# Altium project 6axisMIK.PrjPcb
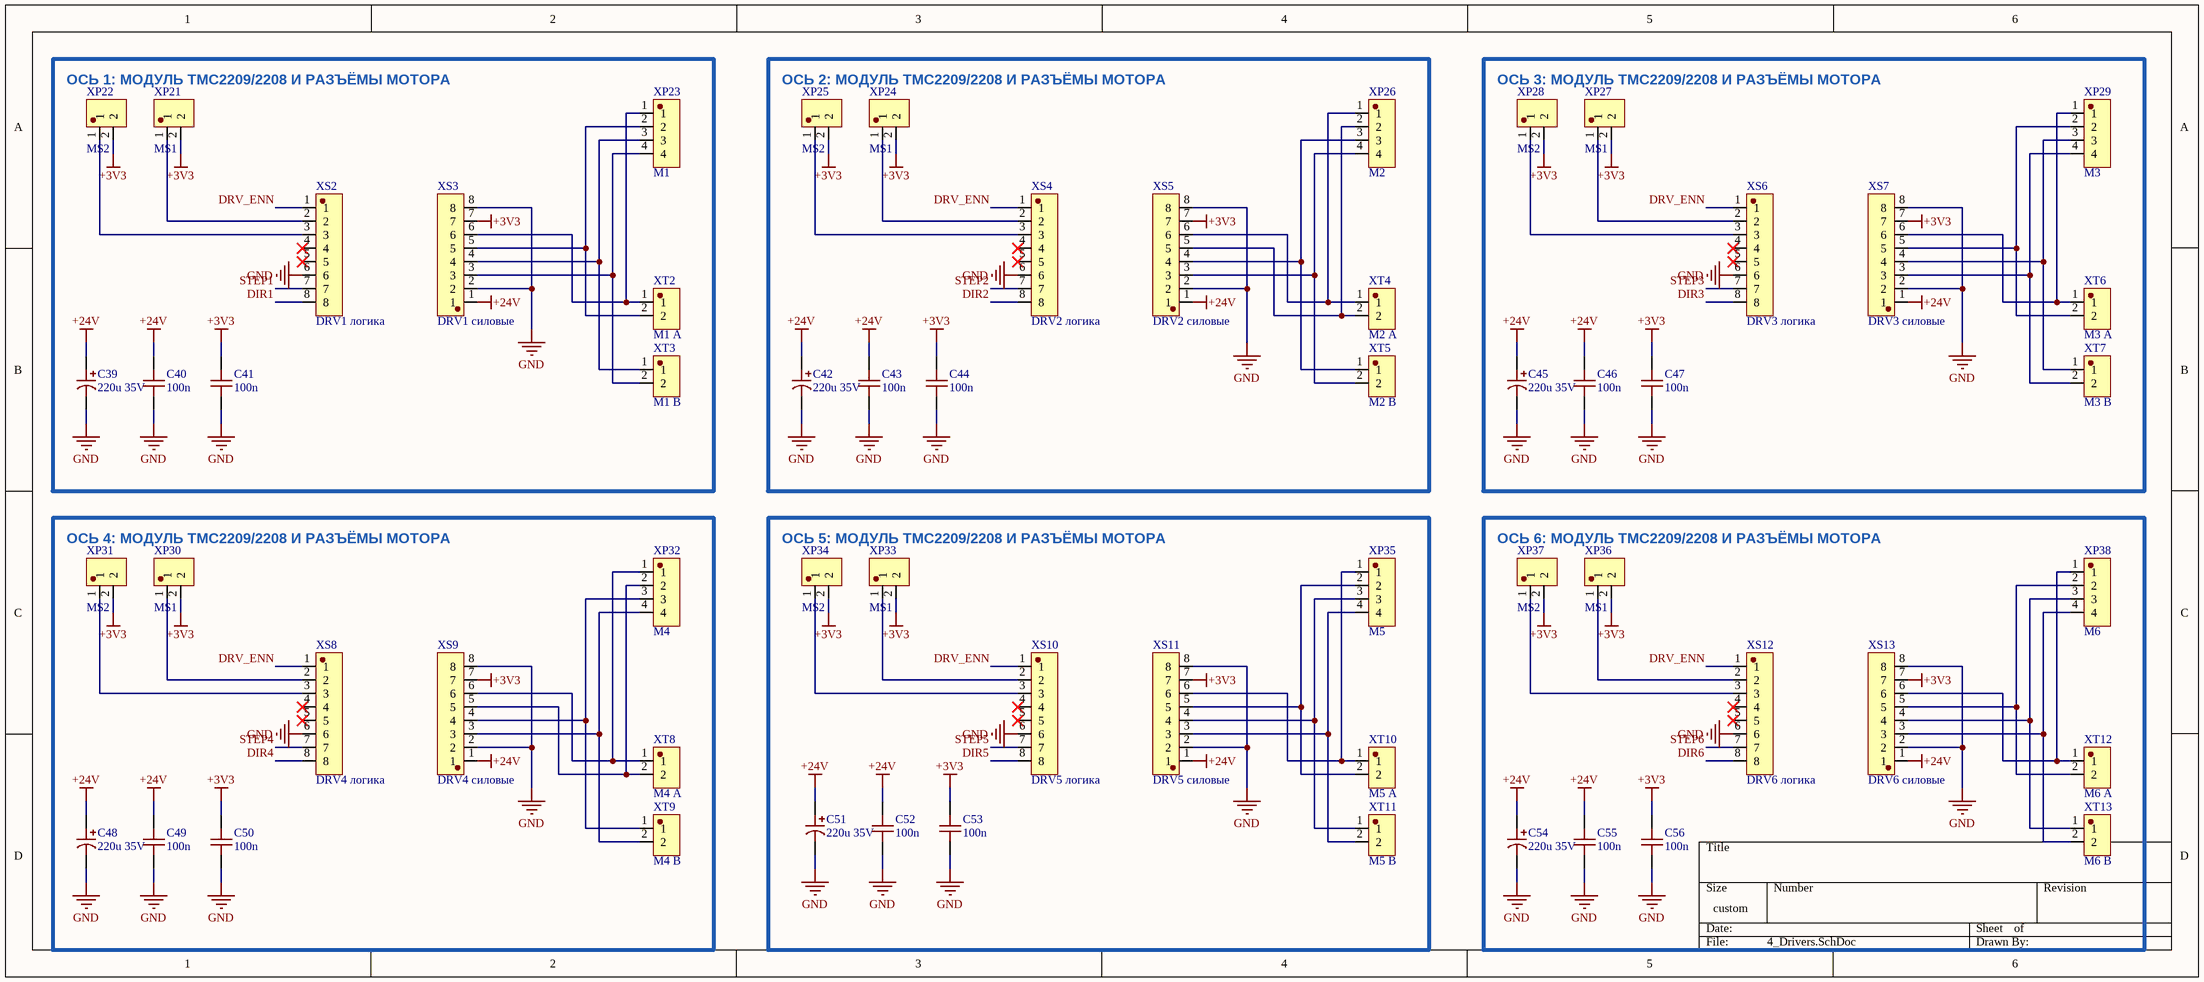
[diagram p0: 4_Drivers.SchDoc]
4 sheets, 200 parts. Net scope: global (net labels, ports and power ports of the same name join across sheets).
Board file: PCB1.PcbDoc
Sheets:
  4_Drivers.SchDoc
  3_IO.SchDoc
  1_Power.SchDoc
  2_MCU.SchDoc

## Sheet 4_Drivers.SchDoc
size 412 x 182 mm; SheetNumber: 1; SheetTotal: 4

### Parts
C39  220u 35V  [CAP-TH_BD8.0-P3.50-D0.5-FD]
C40  100n  [C0603]
C41  100n  [C0603]
C42  220u 35V  [CAP-TH_BD8.0-P3.50-D0.5-FD]
C43  100n  [C0603]
C44  100n  [C0603]
C45  220u 35V  [CAP-TH_BD8.0-P3.50-D0.5-FD]
C46  100n  [C0603]
C47  100n  [C0603]
C48  220u 35V  [CAP-TH_BD8.0-P3.50-D0.5-FD]
C49  100n  [C0603]
C50  100n  [C0603]
C51  220u 35V  [CAP-TH_BD8.0-P3.50-D0.5-FD]
C52  100n  [C0603]
C53  100n  [C0603]
C54  220u 35V  [CAP-TH_BD8.0-P3.50-D0.5-FD]
C55  100n  [C0603]
C56  100n  [C0603]
XP21  MS1  [HDR-TH_2P-P2.54-V-M]
XP22  MS2  [HDR-TH_2P-P2.54-V-M]
XP23  M1  [HDR-TH_4P-P2.54-V-M]
XP24  MS1  [HDR-TH_2P-P2.54-V-M]
XP25  MS2  [HDR-TH_2P-P2.54-V-M]
XP26  M2  [HDR-TH_4P-P2.54-V-M]
XP27  MS1  [HDR-TH_2P-P2.54-V-M]
XP28  MS2  [HDR-TH_2P-P2.54-V-M]
XP29  M3  [HDR-TH_4P-P2.54-V-M]
XP30  MS1  [HDR-TH_2P-P2.54-V-M]
XP31  MS2  [HDR-TH_2P-P2.54-V-M]
XP32  M4  [HDR-TH_4P-P2.54-V-M]
XP33  MS1  [HDR-TH_2P-P2.54-V-M]
XP34  MS2  [HDR-TH_2P-P2.54-V-M]
XP35  M5  [HDR-TH_4P-P2.54-V-M]
XP36  MS1  [HDR-TH_2P-P2.54-V-M]
XP37  MS2  [HDR-TH_2P-P2.54-V-M]
XP38  M6  [HDR-TH_4P-P2.54-V-M]
XS2  DRV1 логика  [HDR-TH_PZ254V-11-08P-A40]
XS3  DRV1 силовые  [HDR-TH_PZ254V-11-08P-A40]
XS4  DRV2 логика  [HDR-TH_PZ254V-11-08P-A40]
XS5  DRV2 силовые  [HDR-TH_PZ254V-11-08P-A40]
XS6  DRV3 логика  [HDR-TH_PZ254V-11-08P-A40]
XS7  DRV3 силовые  [HDR-TH_PZ254V-11-08P-A40]
XS8  DRV4 логика  [HDR-TH_PZ254V-11-08P-A40]
XS9  DRV4 силовые  [HDR-TH_PZ254V-11-08P-A40]
XS10  DRV5 логика  [HDR-TH_PZ254V-11-08P-A40]
XS11  DRV5 силовые  [HDR-TH_PZ254V-11-08P-A40]
XS12  DRV6 логика  [HDR-TH_PZ254V-11-08P-A40]
XS13  DRV6 силовые  [HDR-TH_PZ254V-11-08P-A40]
XT2  M1 A  [CONN-TH_P3.50_KF350-3.5-2P]
XT3  M1 B  [CONN-TH_P3.50_KF350-3.5-2P]
XT4  M2 A  [CONN-TH_P3.50_KF350-3.5-2P]
XT5  M2 B  [CONN-TH_P3.50_KF350-3.5-2P]
XT6  M3 A  [CONN-TH_P3.50_KF350-3.5-2P]
XT7  M3 B  [CONN-TH_P3.50_KF350-3.5-2P]
XT8  M4 A  [CONN-TH_P3.50_KF350-3.5-2P]
XT9  M4 B  [CONN-TH_P3.50_KF350-3.5-2P]
XT10  M5 A  [CONN-TH_P3.50_KF350-3.5-2P]
XT11  M5 B  [CONN-TH_P3.50_KF350-3.5-2P]
XT12  M6 A  [CONN-TH_P3.50_KF350-3.5-2P]
XT13  M6 B  [CONN-TH_P3.50_KF350-3.5-2P]

### Blocks framed on the sheet
ОСЬ 1: МОДУЛЬ TMC2209/2208 И РАЗЪЁМЫ МОТОРА: C39-C41 XP21-XP23 XS2 XS3 XT2 XT3
ОСЬ 2: МОДУЛЬ TMC2209/2208 И РАЗЪЁМЫ МОТОРА: C42-C44 XP24-XP26 XS4 XS5 XT4 XT5
ОСЬ 3: МОДУЛЬ TMC2209/2208 И РАЗЪЁМЫ МОТОРА: C45-C47 XP27-XP29 XS6 XS7 XT6 XT7
ОСЬ 4: МОДУЛЬ TMC2209/2208 И РАЗЪЁМЫ МОТОРА: C48-C50 XP30-XP32 XS8 XS9 XT8 XT9
ОСЬ 5: МОДУЛЬ TMC2209/2208 И РАЗЪЁМЫ МОТОРА: C51-C53 XP33-XP35 XS10 XS11 XT10 XT11
ОСЬ 6: МОДУЛЬ TMC2209/2208 И РАЗЪЁМЫ МОТОРА: C54-C56 XP36-XP38 XS12 XS13 XT12 XT13

### Nets
+3V3: C41.1 C44.1 C47.1 C50.1 C53.1 C56.1 XP21.2 XP22.2 XP24.2 XP25.2 XP27.2 XP28.2 XP30.2 XP31.2 XP33.2 XP34.2 XP36.2 XP37.2 XS3.7 XS5.7 XS7.7 XS9.7 XS11.7 XS13.7
+24V: C39.1 C40.1 C42.1 C43.1 C45.1 C46.1 C48.1 C49.1 C51.1 C52.1 C54.1 C55.1 XS3.1 XS5.1 XS7.1 XS9.1 XS11.1 XS13.1
GND: C39.2 C40.2 C41.2 C42.2 C43.2 C44.2 C45.2 C46.2 C47.2 C48.2 C49.2 C50.2 C51.2 C52.2 C53.2 C54.2 C55.2 C56.2 XS2.6 XS3.2 XS3.8 XS4.6 XS5.2 XS5.8 XS6.6 XS7.2 XS7.8 XS8.6 XS9.2 XS9.8 XS10.6 XS11.2 XS11.8 XS12.6 XS13.2 XS13.8
DIR1: XS2.8
DIR2: XS4.8
DIR3: XS6.8
DIR4: XS8.8
DIR5: XS10.8
DIR6: XS12.8
DRV_ENN: XS2.1 XS4.1 XS6.1 XS8.1 XS10.1 XS12.1
STEP1: XS2.7
STEP2: XS4.7
STEP3: XS6.7
STEP4: XS8.7
STEP5: XS10.7
STEP6: XS12.7
NetXP21_1: XP21.1 XS2.2
NetXP22_1: XP22.1 XS2.3
NetXP23_1: XP23.1 XS3.6 XT2.1
NetXP23_2: XP23.2 XS3.5 XT2.2
NetXP23_3: XP23.3 XS3.4 XT3.1
NetXP23_4: XP23.4 XS3.3 XT3.2
NetXP24_1: XP24.1 XS4.2
NetXP25_1: XP25.1 XS4.3
NetXP26_1: XP26.1 XS5.6 XT4.1
NetXP26_2: XP26.2 XS5.5 XT4.2
NetXP26_3: XP26.3 XS5.4 XT5.1
NetXP26_4: XP26.4 XS5.3 XT5.2
NetXP27_1: XP27.1 XS6.2
NetXP28_1: XP28.1 XS6.3
NetXP29_1: XP29.1 XS7.6 XT6.1
NetXP29_2: XP29.2 XS7.5 XT6.2
NetXP29_3: XP29.3 XS7.4 XT7.1
NetXP29_4: XP29.4 XS7.3 XT7.2
NetXP30_1: XP30.1 XS8.2
NetXP31_1: XP31.1 XS8.3
NetXP32_1: XP32.1 XS9.6 XT8.1
NetXP32_2: XP32.2 XS9.5 XT8.2
NetXP32_3: XP32.3 XS9.4 XT9.1
NetXP32_4: XP32.4 XS9.3 XT9.2
NetXP33_1: XP33.1 XS10.2
NetXP34_1: XP34.1 XS10.3
NetXP35_1: XP35.1 XS11.6 XT10.1
NetXP35_2: XP35.2 XS11.5 XT10.2
NetXP35_3: XP35.3 XS11.4 XT11.1
NetXP35_4: XP35.4 XS11.3 XT11.2
NetXP36_1: XP36.1 XS12.2
NetXP37_1: XP37.1 XS12.3
NetXP38_1: XP38.1 XS13.6 XT12.1
NetXP38_2: XP38.2 XS13.5 XT12.2
NetXP38_3: XP38.3 XS13.4 XT13.1
NetXP38_4: XP38.4 XS13.3 XT13.2

Not connected (* = marked no-connect by the designer): XS2 4* 5*; XS4 4* 5*; XS6 4* 5*; XS8 4* 5*; XS10 4* 5*; XS12 4* 5*

### Library data of the parts
C39 C42 C45 C48 C51 C54 = 220UF35V8X12KM: Manufacturer: Econd; Value: 220uF; Manufacturer Part Number: 220uF35V8x12KM; LCSC Part: C49304872; Supplier: LCSC; Supplier Part Number: C49304872; JLCPCB Part Class: Extended Part; Datasheet: https://www.lcsc.com/datasheet/C49304872.pdf; Source: JLCEDA/EasyEDA Official Library (https://easyeda.com, https://lceda.cn)
C40 C41 C43 C44 C46 C47 C49 C50 C52 C53 C55 C56 = CL10B104KB8NNNC/0603: Manufacturer Part Number: CL10B104KB8NNNC/0603; LCSC Part: C9900007620; Supplier: LCSC; Supplier Part Number: C9900007620; Datasheet: https://www.lcsc.com/datasheet/C9900007620.pdf; Source: JLCEDA/EasyEDA Official Library (https://easyeda.com, https://lceda.cn)
XP21 XP22 XP24 XP25 XP27 XP28 XP30 XP31 XP33 XP34 XP36 XP37 = PZ254V-11-02P: Manufacturer: XFCN; Manufacturer Part Number: PZ254V-11-02P; LCSC Part: C492401; Supplier: LCSC; Supplier Part Number: C492401; JLCPCB Part Class: Extended Part; Datasheet: https://www.lcsc.com/datasheet/C492401.pdf; LCSC URL: https://lcsc.com/product-detail/New-Arrivals_XFCN-PZ254V-11-02P_C492401.html; Source: JLCEDA/EasyEDA Official Library (https://easyeda.com, https://lceda.cn)
XP23 XP26 XP29 XP32 XP35 XP38 = PZ254V-11-04P_C2691448: Manufacturer: XFCN; Manufacturer Part Number: PZ254V-11-04P; LCSC Part: C2691448; Supplier: LCSC; Supplier Part Number: C2691448; JLCPCB Part Class: Extended Part; Datasheet: https://www.lcsc.com/datasheet/C2691448.pdf; Source: JLCEDA/EasyEDA Official Library (https://easyeda.com, https://lceda.cn)
XS2-XS13 = PZ254V-11-08P-A40: Manufacturer: XFCN; Manufacturer Part Number: PZ254V-11-08P-A40; LCSC Part: C42419915; Supplier: LCSC; Supplier Part Number: C42419915; JLCPCB Part Class: Extended Part; Datasheet: https://www.lcsc.com/datasheet/C42419915.pdf; Source: JLCEDA/EasyEDA Official Library (https://easyeda.com, https://lceda.cn)
XT2-XT13 = KF350-3.5-2P: Manufacturer: KEFA; Manufacturer Part Number: KF350-3.5-2P; LCSC Part: C474892; Supplier: LCSC; Supplier Part Number: C474892; JLCPCB Part Class: Extended Part; Datasheet: https://www.lcsc.com/datasheet/C474892.pdf; LCSC URL: https://lcsc.com/product-detail/New-Quadratic-Unclassified-Data_Cixi-Kefa-Elec-KF350-3-5-2P_C474892.html; Source: JLCEDA/EasyEDA Official Library (https://easyeda.com, https://lceda.cn)

## Sheet 3_IO.SchDoc
size 383 x 325 mm; SheetNumber: 2; SheetTotal: 4
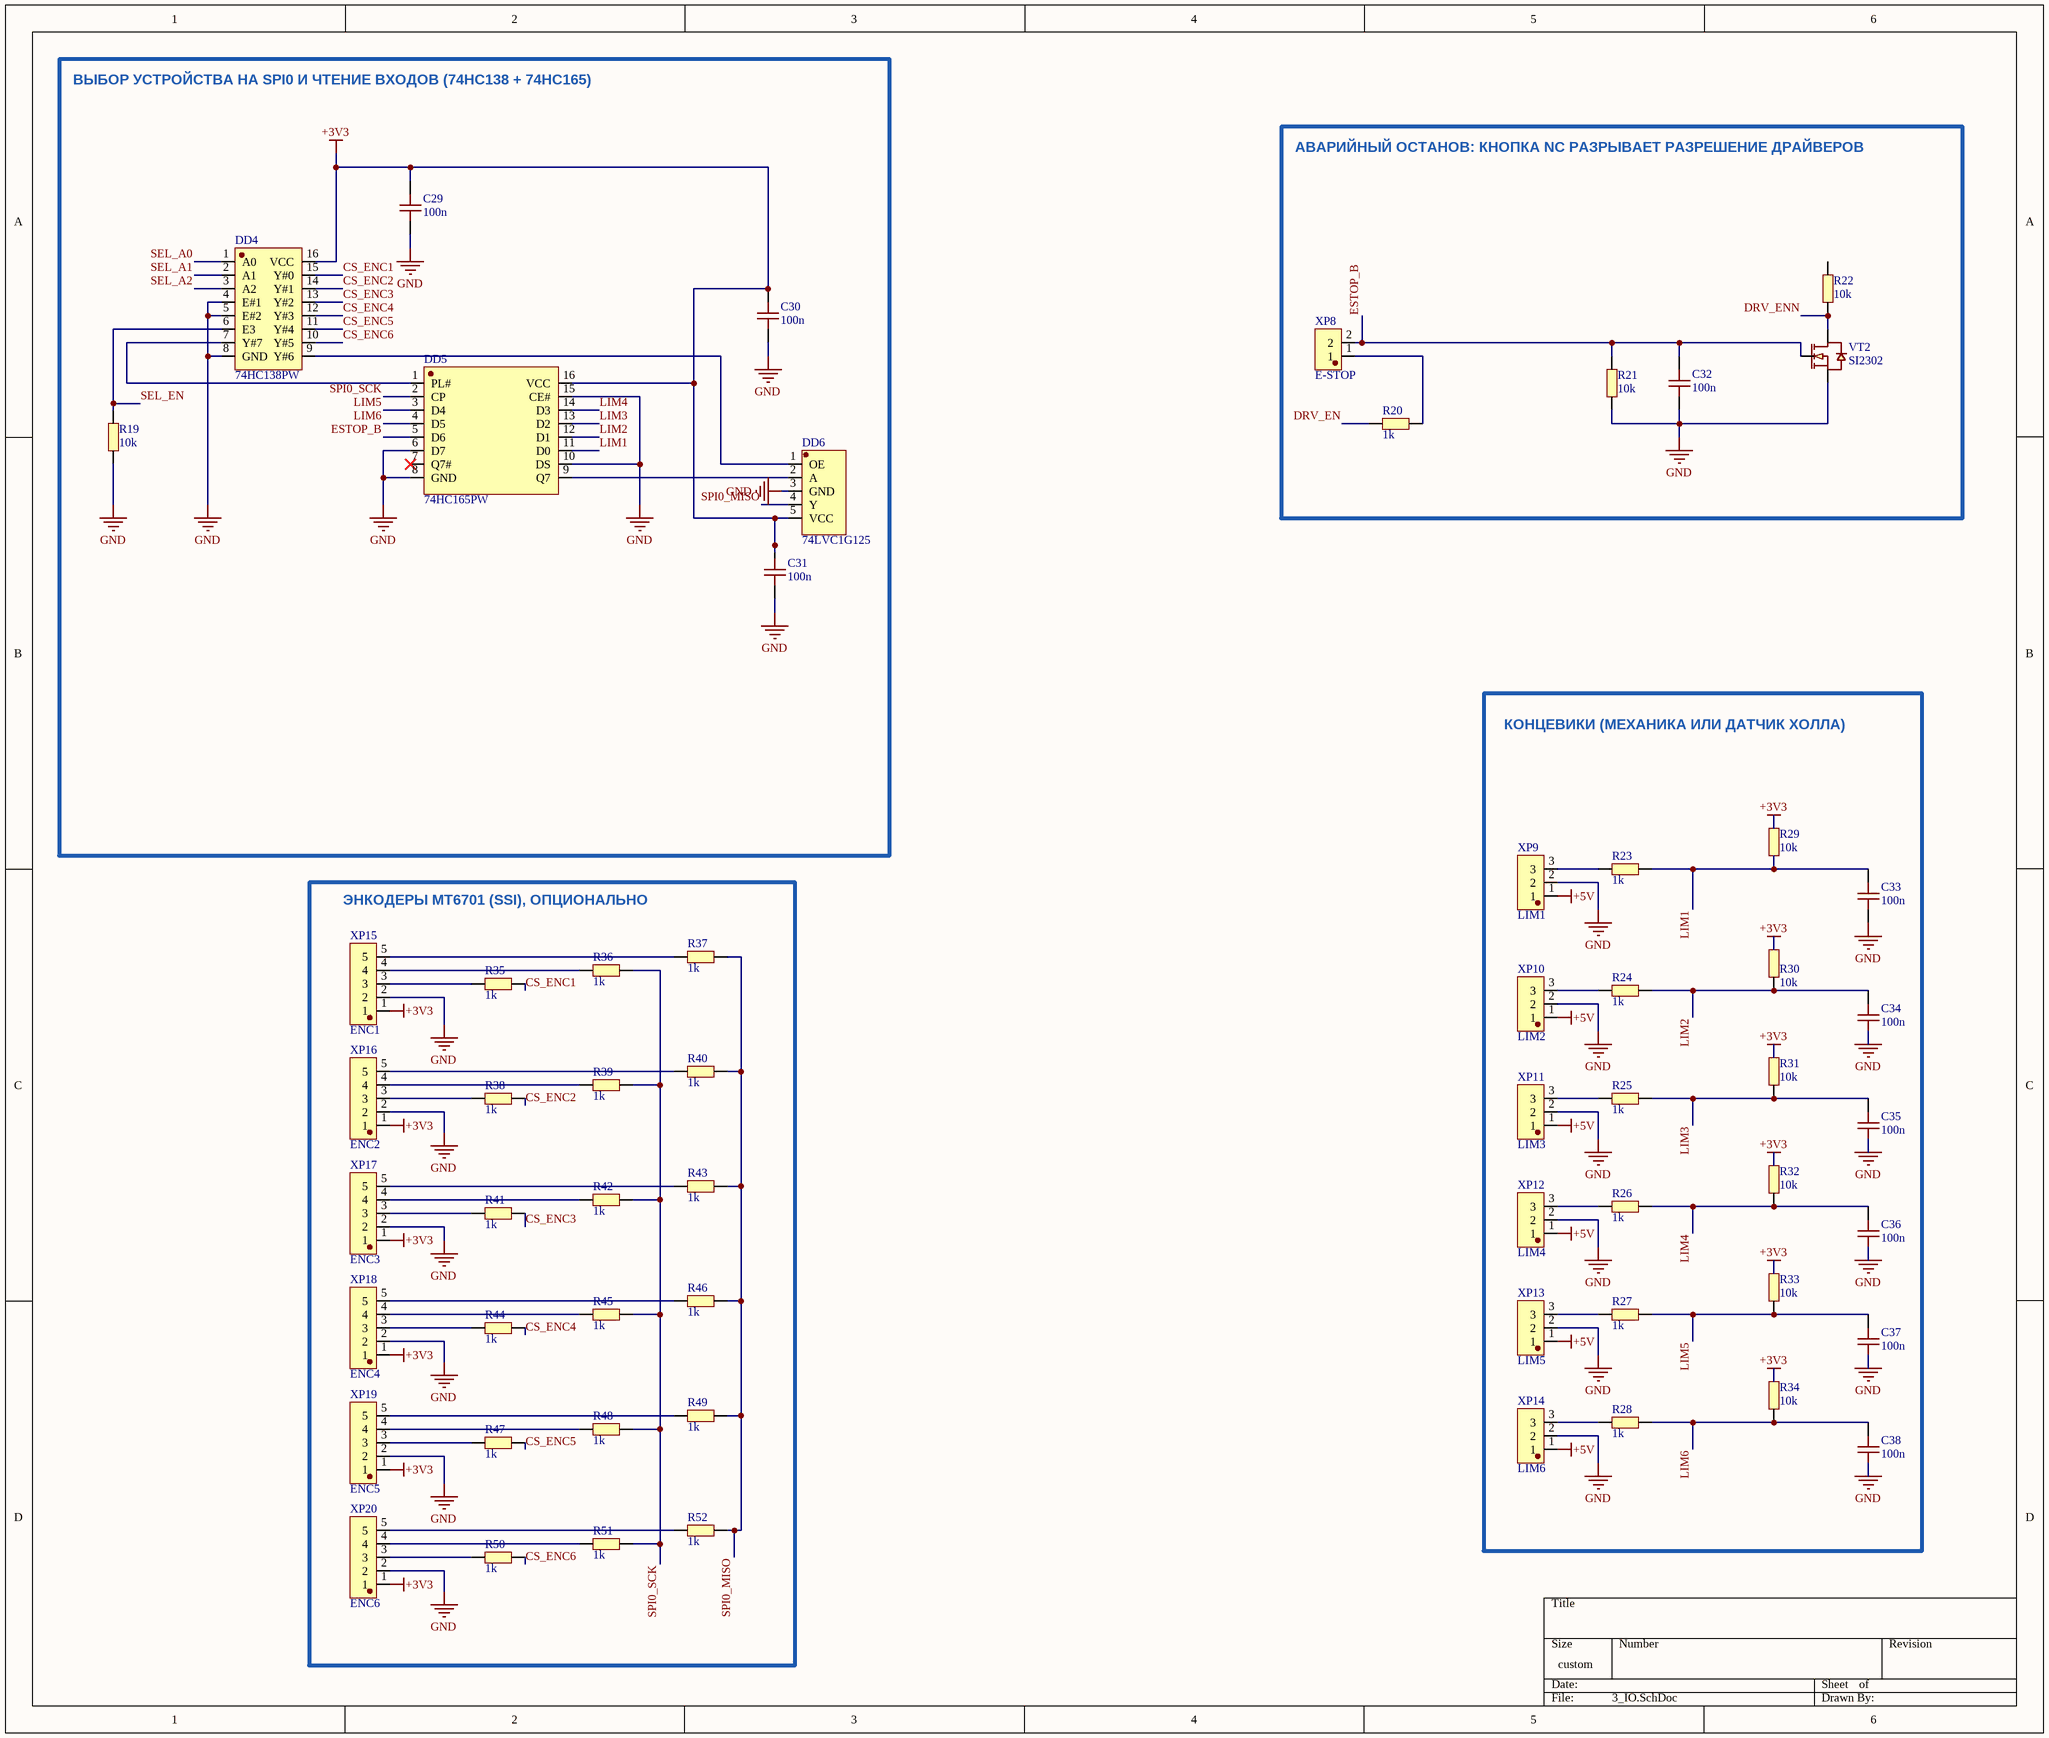
[diagram p1: 3_IO.SchDoc]

### Parts
C29  100n  [C0603]
C30  100n  [C0603]
C31  100n  [C0603]
C32  100n  [C0603]
C33  100n  [C0603]
C34  100n  [C0603]
C35  100n  [C0603]
C36  100n  [C0603]
C37  100n  [C0603]
C38  100n  [C0603]
DD4  74HC138PW  [TSSOP-16_L5.0-W4.4-P0.65-LS6.4-BL]
DD5  74HC165PW  [TSSOP-16_L5.0-W4.4-P0.65-LS6.4-BL]
DD6  74LVC1G125  [SOT-23-5_L3.0-W1.7-P0.95-LS2.8-BL]
R19  10k  [R0603]
R20  1k  [R0603]
R21  10k  [R0603]
R22  10k  [R0603]
R23  1k  [R0603]
R24  1k  [R0603]
R25  1k  [R0603]
R26  1k  [R0603]
R27  1k  [R0603]
R28  1k  [R0603]
R29  10k  [R0603]
R30  10k  [R0603]
R31  10k  [R0603]
R32  10k  [R0603]
R33  10k  [R0603]
R34  10k  [R0603]
R35  1k  [R0603]
R36  1k  [R0603]
R37  1k  [R0603]
R38  1k  [R0603]
R39  1k  [R0603]
R40  1k  [R0603]
R41  1k  [R0603]
R42  1k  [R0603]
R43  1k  [R0603]
R44  1k  [R0603]
R45  1k  [R0603]
R46  1k  [R0603]
R47  1k  [R0603]
R48  1k  [R0603]
R49  1k  [R0603]
R50  1k  [R0603]
R51  1k  [R0603]
R52  1k  [R0603]
VT2  SI2302  [SOT-23-3_L2.9-W1.3-P1.90-LS2.4-BR-CW]
XP8  E-STOP  [HDR-TH_2P-P2.54-V-M]
XP9  LIM1  [HDR-TH_3P-P2.54-V-M_PZ254V-11-03P]
XP10  LIM2  [HDR-TH_3P-P2.54-V-M_PZ254V-11-03P]
XP11  LIM3  [HDR-TH_3P-P2.54-V-M_PZ254V-11-03P]
XP12  LIM4  [HDR-TH_3P-P2.54-V-M_PZ254V-11-03P]
XP13  LIM5  [HDR-TH_3P-P2.54-V-M_PZ254V-11-03P]
XP14  LIM6  [HDR-TH_3P-P2.54-V-M_PZ254V-11-03P]
XP15  ENC1  [HDR-TH_5P-P2.54-V-M]
XP16  ENC2  [HDR-TH_5P-P2.54-V-M]
XP17  ENC3  [HDR-TH_5P-P2.54-V-M]
XP18  ENC4  [HDR-TH_5P-P2.54-V-M]
XP19  ENC5  [HDR-TH_5P-P2.54-V-M]
XP20  ENC6  [HDR-TH_5P-P2.54-V-M]

### Blocks framed on the sheet
ВЫБОР УСТРОЙСТВА НА SPI0 И ЧТЕНИЕ ВХОДОВ (74HC138 + 74HC165): C29-C31 DD4-DD6 R19
АВАРИЙНЫЙ ОСТАНОВ: КНОПКА NC РАЗРЫВАЕТ РАЗРЕШЕНИЕ ДРАЙВЕРОВ: C32 R20-R22 VT2 XP8
КОНЦЕВИКИ (МЕХАНИКА ИЛИ ДАТЧИК ХОЛЛА): C33-C38 R23-R34 XP9-XP14
ЭНКОДЕРЫ MT6701 (SSI), ОПЦИОНАЛЬНО: R35-R52 XP15-XP20

### Nets
+3V3: C29.1 C30.1 C31.1 DD4.16(VCC) DD5.16(VCC) DD6.5(VCC) R29.2 R30.2 R31.2 R32.2 R33.2 R34.2 XP15.1 XP16.1 XP17.1 XP18.1 XP19.1 XP20.1
+5V: XP9.1 XP10.1 XP11.1 XP12.1 XP13.1 XP14.1
GND: C29.2 C30.2 C31.2 C32.2 C33.2 C34.2 C35.2 C36.2 C37.2 C38.2 DD4.4(E#1) DD4.5(E#2) DD4.8(GND) DD5.6(D7) DD5.8(GND) DD5.10(DS) DD5.15(CE#) DD6.3(GND) R19.2 R21.2 VT2.3(S) XP9.2 XP10.2 XP11.2 XP12.2 XP13.2 XP14.2 XP15.2 XP16.2 XP17.2 XP18.2 XP19.2 XP20.2
CS_ENC1: DD4.15(Y#0) R35.2
CS_ENC2: DD4.14(Y#1) R38.2
CS_ENC3: DD4.13(Y#2) R41.2
CS_ENC4: DD4.12(Y#3) R44.2
CS_ENC5: DD4.11(Y#4) R47.2
CS_ENC6: DD4.10(Y#5) R50.2
DRV_EN: R20.1
DRV_ENN: R22.1 VT2.2(D)
ESTOP_B: C32.1 DD5.5(D6) R21.1 VT2.1(G) XP8.2
LIM1: C33.1 DD5.11(D0) R23.2 R29.1
LIM2: C34.1 DD5.12(D1) R24.2 R30.1
LIM3: C35.1 DD5.13(D2) R25.2 R31.1
LIM4: C36.1 DD5.14(D3) R26.2 R32.1
LIM5: C37.1 DD5.3(D4) R27.2 R33.1
LIM6: C38.1 DD5.4(D5) R28.2 R34.1
SEL_A0: DD4.1(A0)
SEL_A1: DD4.2(A1)
SEL_A2: DD4.3(A2)
SEL_EN: DD4.6(E3) R19.1
SPI0_MISO: DD6.4(Y) R37.2 R40.2 R43.2 R46.2 R49.2 R52.2
SPI0_SCK: DD5.2(CP) R36.2 R39.2 R42.2 R45.2 R48.2 R51.2
NetDD4_7: DD4.7(Y#7) DD5.1(PL#)
NetDD4_9: DD4.9(Y#6) DD6.1(OE)
NetDD5_9: DD5.9(Q7) DD6.2(A)
NetR20_2: R20.2 XP8.1
NetR23_1: R23.1 XP9.3
NetR24_1: R24.1 XP10.3
NetR25_1: R25.1 XP11.3
NetR26_1: R26.1 XP12.3
NetR27_1: R27.1 XP13.3
NetR28_1: R28.1 XP14.3
NetR35_1: R35.1 XP15.3
NetR36_1: R36.1 XP15.4
NetR37_1: R37.1 XP15.5
NetR38_1: R38.1 XP16.3
NetR39_1: R39.1 XP16.4
NetR40_1: R40.1 XP16.5
NetR41_1: R41.1 XP17.3
NetR42_1: R42.1 XP17.4
NetR43_1: R43.1 XP17.5
NetR44_1: R44.1 XP18.3
NetR45_1: R45.1 XP18.4
NetR46_1: R46.1 XP18.5
NetR47_1: R47.1 XP19.3
NetR48_1: R48.1 XP19.4
NetR49_1: R49.1 XP19.5
NetR50_1: R50.1 XP20.3
NetR51_1: R51.1 XP20.4
NetR52_1: R52.1 XP20.5

Not connected (* = marked no-connect by the designer): DD5 7(Q7#)*; R22 2

### Library data of the parts
C29-C38 = CL10B104KB8NNNC/0603: Manufacturer Part Number: CL10B104KB8NNNC/0603; LCSC Part: C9900007620; Supplier: LCSC; Supplier Part Number: C9900007620; Datasheet: https://www.lcsc.com/datasheet/C9900007620.pdf; Source: JLCEDA/EasyEDA Official Library (https://easyeda.com, https://lceda.cn)
DD4 = 74HC138PW-Q100,118: Manufacturer: Nexperia; Manufacturer Part Number: 74HC138PW-Q100,118; LCSC Part: C546575; Supplier: LCSC; Supplier Part Number: C546575; JLCPCB Part Class: Extended Part; Datasheet: https://www.lcsc.com/datasheet/C546575.pdf; LCSC URL: https://lcsc.com/product-detail/presales_Nexperia-74HC138PW-Q100-118_C546575.html; Source: JLCEDA/EasyEDA Official Library (https://easyeda.com, https://lceda.cn)
DD5 = 74HC165PW,118: Manufacturer: Nexperia; Manufacturer Part Number: 74HC165PW,118; LCSC Part: C80696; Supplier: LCSC; Supplier Part Number: C80696; JLCPCB Part Class: Extended Part; Datasheet: https://www.lcsc.com/datasheet/C80696.pdf; LCSC URL: https://lcsc.com/product-detail/74-Series_NXP_74HC165PW_74HC165PW_C80696.html; Source: JLCEDA/EasyEDA Official Library (https://easyeda.com, https://lceda.cn)
DD6 = SN74LVC1G125DBVR: Manufacturer: TI; Manufacturer Part Number: SN74LVC1G125DBVR; LCSC Part: C23654; Supplier: LCSC; Supplier Part Number: C23654; JLCPCB Part Class: Extended Part; Datasheet: https://www.lcsc.com/datasheet/C23654.pdf; LCSC URL: https://lcsc.com/product-detail/74-Series_TI_SN74LVC1G125DBVR_SN74LVC1G125DBVR_C23654.html; Source: JLCEDA/EasyEDA Official Library (https://easyeda.com, https://lceda.cn)
R19-R52 = 0603WAF1002T5E: 10KOhm (1002) ±1%; Manufacturer: UNI-ROYAL; Value: 10kΩ; Manufacturer Part Number: 0603WAF1002T5E; LCSC Part: C25804; Supplier: LCSC; Supplier Part Number: C25804; JLCPCB Part Class: Basic Part; Datasheet: https://www.lcsc.com/datasheet/C25804.pdf; LCSC URL: https://lcsc.com/product-detail/Chip-Resistor-Surface-Mount-UniOhm_10KR-1002-1_C25804.html; Source: JLCEDA/EasyEDA Official Library (https://easyeda.com, https://lceda.cn)
VT2 = SI2302DDS-T1-GE3-HXY: Manufacturer: HXY MOSFET; Manufacturer Part Number: Si2302DDS-T1-GE3-HXY; LCSC Part: C22367242; Supplier: LCSC; Supplier Part Number: C22367242; JLCPCB Part Class: Extended Part; Datasheet: https://www.lcsc.com/datasheet/C22367242.pdf; Source: JLCEDA/EasyEDA Official Library (https://easyeda.com, https://lceda.cn)
XP8 = PZ254V-11-02P: Manufacturer: XFCN; Manufacturer Part Number: PZ254V-11-02P; LCSC Part: C492401; Supplier: LCSC; Supplier Part Number: C492401; JLCPCB Part Class: Extended Part; Datasheet: https://www.lcsc.com/datasheet/C492401.pdf; LCSC URL: https://lcsc.com/product-detail/New-Arrivals_XFCN-PZ254V-11-02P_C492401.html; Source: JLCEDA/EasyEDA Official Library (https://easyeda.com, https://lceda.cn)
XP9-XP14 = PZ254V-11-03P_C2937625: Manufacturer: XFCN; Manufacturer Part Number: PZ254V-11-03P; LCSC Part: C2937625; Supplier: LCSC; Supplier Part Number: C2937625; JLCPCB Part Class: Extended Part; Datasheet: https://www.lcsc.com/datasheet/C2937625.pdf; Source: JLCEDA/EasyEDA Official Library (https://easyeda.com, https://lceda.cn)
XP15-XP20 = PZ254V-11-05P: Manufacturer: XFCN; Manufacturer Part Number: PZ254V-11-05P; LCSC Part: C492404; Supplier: LCSC; Supplier Part Number: C492404; JLCPCB Part Class: Extended Part; Datasheet: https://www.lcsc.com/datasheet/C492404.pdf; LCSC URL: https://lcsc.com/product-detail/New-Arrivals_XFCN-PZ254V-11-05P_C492404.html; Source: JLCEDA/EasyEDA Official Library (https://easyeda.com, https://lceda.cn)

## Sheet 1_Power.SchDoc
size 419 x 256 mm; SheetNumber: 3; SheetTotal: 4
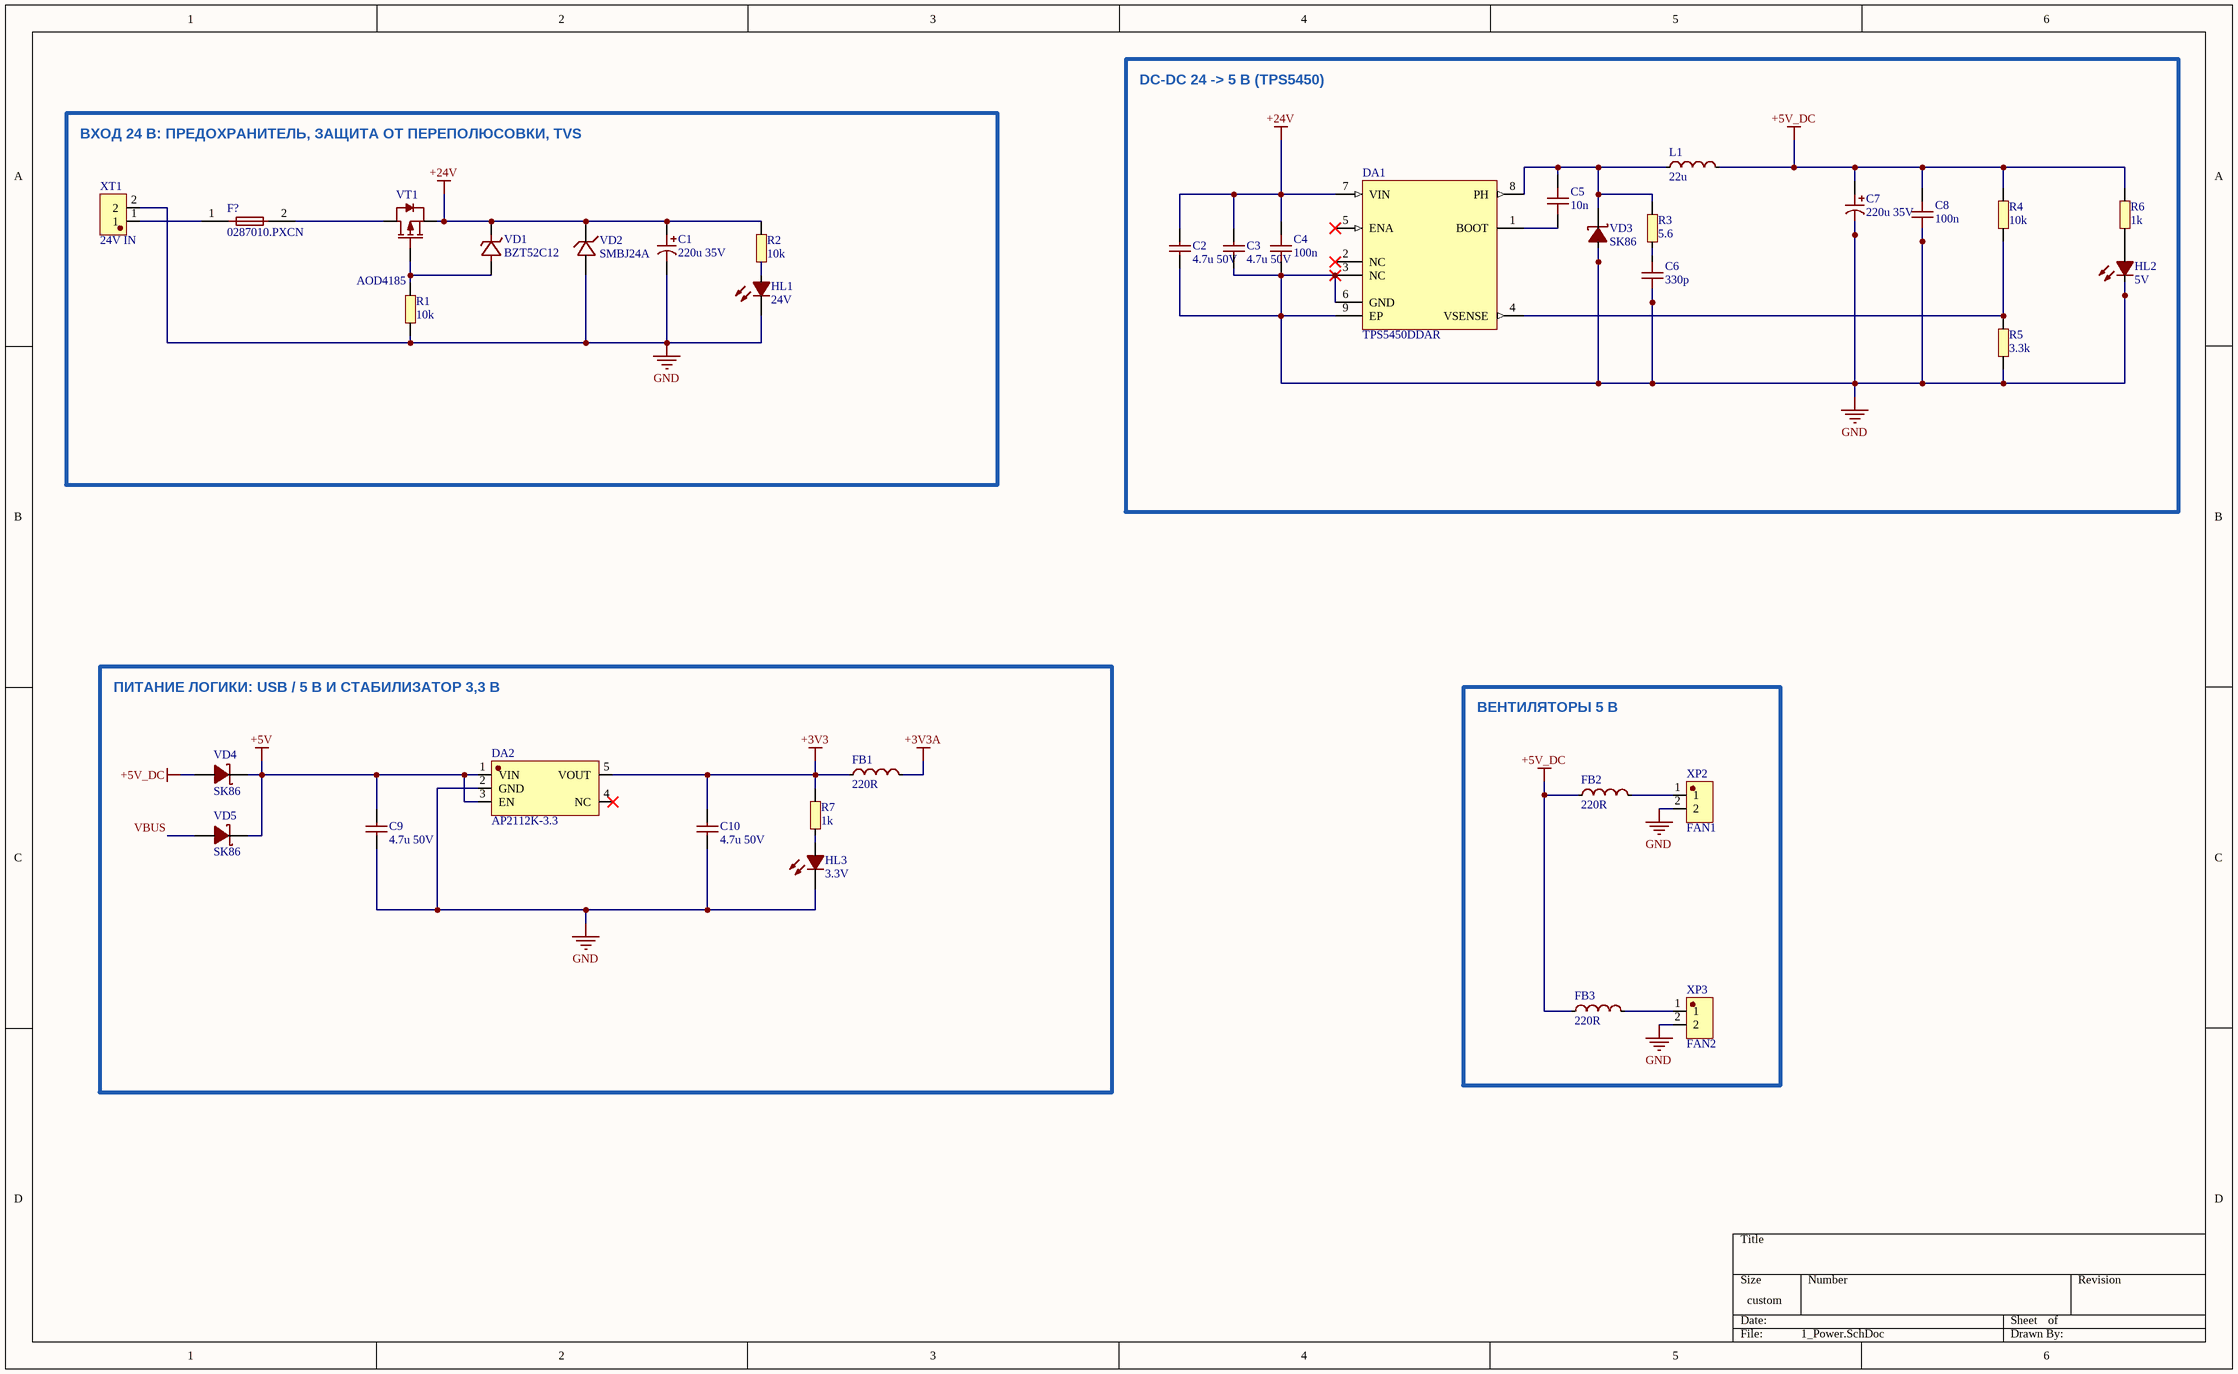
[diagram p2: 1_Power.SchDoc]

### Parts
C1  220u 35V  [CAP-TH_BD8.0-P3.50-D0.5-FD]
C2  4.7u 50V  [C1206]
C3  4.7u 50V  [C1206]
C4  100n  [C0603]
C5  10n  [C0603]
C6  330p  [C0603]
C7  220u 35V  [CAP-TH_BD8.0-P3.50-D0.5-FD]
C8  100n  [C0603]
C9  4.7u 50V  [C1206]
C10  4.7u 50V  [C1206]
DA1  TPS5450DDAR  [SOP-8_L4.9-W3.9-P1.27-LS6.0-BL-EP]
DA2  AP2112K-3.3  [SOT-25-5_L2.9-W1.6-P0.95-LS2.8-BL]
F?  0287010.PXCN  [FUSE-TH_L19.1-W5.1]
FB1  220R  [L0805]
FB2  220R  [L0805]
FB3  220R  [L0805]
HL1  24V  [LED0603-RD_GREEN]
HL2  5V  [LED0603-RD_GREEN]
HL3  3.3V  [LED0603-RD_GREEN]
L1  22u  [IND-SMD_L8.0-W8.0]
R1  10k  [R0603]
R2  10k  [R0603]
R3  5.6  [R0603]
R4  10k  [R0603]
R5  3.3k  [R0603]
R6  1k  [R0603]
R7  1k  [R0603]
VD1  BZT52C12  [SOD-123_L2.7-W1.6-LS3.7-RD-1]
VD2  SMBJ24A  [SMB_L4.3-W3.6-LS5.4-RD]
VD3  SK86  [SMC_L7.1-W6.2-LS8.1-R-RD]
VD4  SK86  [SMC_L7.1-W6.2-LS8.1-R-RD]
VD5  SK86  [SMC_L7.1-W6.2-LS8.1-R-RD]
VT1  AOD4185  [TO-252-3_L6.5-W5.8-P4.58-BL]
XP2  FAN1  [HDR-TH_2P-P2.54-V-M]
XP3  FAN2  [HDR-TH_2P-P2.54-V-M]
XT1  24V IN  [CONN-TH_P3.50_KF350-3.5-2P]

### Blocks framed on the sheet
DC-DC 24 -> 5 В (TPS5450): C2-C8 DA1 HL2 L1 R3-R6 VD3
ВХОД 24 В: ПРЕДОХРАНИТЕЛЬ, ЗАЩИТА ОТ ПЕРЕПОЛЮСОВКИ, TVS: C1 F? HL1 R1 R2 VD1 VD2 VT1 XT1
ПИТАНИЕ ЛОГИКИ: USB / 5 В И СТАБИЛИЗАТОР 3,3 В: C9 C10 DA2 FB1 HL3 R7 VD4 VD5
ВЕНТИЛЯТОРЫ 5 В: FB2 FB3 XP2 XP3

### Nets
+3V3: C10.1 DA2.5(VOUT) FB1.1 R7.1
+3V3A: FB1.2
+5V: C9.1 DA2.1(VIN) DA2.3(EN) VD4.2(K) VD5.2(K)
+5V_DC: C7.1 C8.1 FB2.1 FB3.1 L1.2 R4.1 R6.1 VD4.1(A)
+24V: C1.1 C2.1 C3.1 C4.1 DA1.7(VIN) R2.1 VD1.1(C) VD2.1 VT1.3(S)
GND: C1.2 C2.2 C3.2 C4.2 C6.2 C7.2 C8.2 C9.2 C10.2 DA1.3(NC) DA1.6(GND) DA1.9(EP) DA2.2(GND) HL1.1(C) HL2.1(C) HL3.1(C) R1.2 R5.2 VD2.2 VD3.1(A) XP2.2 XP3.2 XT1.2
VBUS: VD5.1(A)
NetC5_1: C5.1 DA1.8(PH) L1.1 R3.1 VD3.2(K)
NetC5_2: C5.2 DA1.1(BOOT)
NetC6_1: C6.1 R3.2
NetDA1_4: DA1.4(VSENSE) R4.2 R5.1
NetF?_1: F?.1 XT1.1
NetF?_2: F?.2 VT1.2(D)
NetFB2_2: FB2.2 XP2.1
NetFB3_2: FB3.2 XP3.1
NetHL1_2: HL1.2(A) R2.2
NetHL2_2: HL2.2(A) R6.2
NetHL3_2: HL3.2(A) R7.2
NetR1_1: R1.1 VD1.2(A) VT1.1(G)

Not connected (* = marked no-connect by the designer): DA1 2(NC)* 5(ENA)*; DA2 4(NC)*

### Library data of the parts
C1 C7 = 220UF35V8X12KM: Manufacturer: Econd; Value: 220uF; Manufacturer Part Number: 220uF35V8x12KM; LCSC Part: C49304872; Supplier: LCSC; Supplier Part Number: C49304872; JLCPCB Part Class: Extended Part; Datasheet: https://www.lcsc.com/datasheet/C49304872.pdf; Source: JLCEDA/EasyEDA Official Library (https://easyeda.com, https://lceda.cn)
C2 C3 C9 C10 = CL31B475KBHNNNE: 4.7uF (475) ±10% 50V; Manufacturer: SAMSUNG; Value: 4.7uF; Manufacturer Part Number: CL31B475KBHNNNE; LCSC Part: C51205; Supplier: LCSC; Supplier Part Number: C51205; JLCPCB Part Class: Extended Part; Datasheet: https://www.lcsc.com/datasheet/C51205.pdf; LCSC URL: https://lcsc.com/product-detail/Multilayer-Ceramic-Capacitors-MLCC-SMD-SMT_SAMSUNG_CL31B475KBHNNNE_4-7uF-475-10-50V_C51205.html; Source: JLCEDA/EasyEDA Official Library (https://easyeda.com, https://lceda.cn)
C4-C6 C8 = CL10B104KB8NNNC/0603: Manufacturer Part Number: CL10B104KB8NNNC/0603; LCSC Part: C9900007620; Supplier: LCSC; Supplier Part Number: C9900007620; Datasheet: https://www.lcsc.com/datasheet/C9900007620.pdf; Source: JLCEDA/EasyEDA Official Library (https://easyeda.com, https://lceda.cn)
DA1 = TPS5450DDAR: Manufacturer: TI; Manufacturer Part Number: TPS5450DDAR; LCSC Part: C114425; Supplier: LCSC; Supplier Part Number: C114425; JLCPCB Part Class: Extended Part; Datasheet: https://www.lcsc.com/datasheet/C114425.pdf; LCSC URL: https://lcsc.com/product-detail/DC-DC-Converters_TI_TPS5450DDAR_TPS5450DDAR_C114425.html; Source: JLCEDA/EasyEDA Official Library (https://easyeda.com, https://lceda.cn)
DA2 = AP2112K-3.3TRG1: Manufacturer: DIODES; Manufacturer Part Number: AP2112K-3.3TRG1; LCSC Part: C51118; Supplier: LCSC; Supplier Part Number: C51118; JLCPCB Part Class: Extended Part; Datasheet: https://www.lcsc.com/datasheet/C51118.pdf; LCSC URL: https://lcsc.com/product-detail/Low-Dropout-Regulators-LDO_DIODES_AP2112K-3-3TRG1_AP2112K-3-3TRG1_C51118.html; Source: JLCEDA/EasyEDA Official Library (https://easyeda.com, https://lceda.cn)
F? = 0287010.PXCN: Manufacturer: Littelfuse; Manufacturer Part Number: 0287010.PXCN; LCSC Part: C142683; Supplier: LCSC; Supplier Part Number: C142683; JLCPCB Part Class: Extended Part; Datasheet: https://www.lcsc.com/datasheet/C142683.pdf; Source: JLCEDA/EasyEDA Official Library (https://easyeda.com, https://lceda.cn)
FB1-FB3 = BLM21PG221SN1D: 220Ohm ±25% @100MHz 2A; Manufacturer: muRata; Value: 220Ω; Manufacturer Part Number: BLM21PG221SN1D; LCSC Part: C85840; Supplier: LCSC; Supplier Part Number: C85840; JLCPCB Part Class: Extended Part; Datasheet: https://www.lcsc.com/datasheet/C85840.pdf; LCSC URL: https://lcsc.com/product-detail/Ferrite-Beads-And-Chips_muRata_BLM21PG221SN1D_220R-25-at100MHz-2A_C85840.html; Source: JLCEDA/EasyEDA Official Library (https://easyeda.com, https://lceda.cn)
HL1-HL3 = KT-0603GH: Manufacturer Part Number: KT-0603GH; LCSC Part: C9900005170; Supplier: LCSC; Supplier Part Number: C9900005170; JLCPCB Part Class: Extended Part; Datasheet: https://www.lcsc.com/datasheet/C9900005170.pdf; Source: JLCEDA/EasyEDA Official Library (https://easyeda.com, https://lceda.cn)
L1 = SWPA8040S220MT: 22uH ±20%; Manufacturer: Sunlord; Value: 22uH; Manufacturer Part Number: SWPA8040S220MT; LCSC Part: C15857; Supplier: LCSC; Supplier Part Number: C15857; JLCPCB Part Class: Extended Part; Datasheet: https://www.lcsc.com/datasheet/C15857.pdf; LCSC URL: https://lcsc.com/product-detail/Power-Inductors_22uH-20_C15857.html; Source: JLCEDA/EasyEDA Official Library (https://easyeda.com, https://lceda.cn)
R1-R7 = 0603WAF1002T5E: as R19 on sheet 3_IO; Manufacturer Part Number: 0603WAF1002T5E; LCSC Part: C25804; Supplier: LCSC; Supplier Part Number: C25804; JLCPCB Part Class: Basic Part; Datasheet: https://www.lcsc.com/datasheet/C25804.pdf; LCSC URL: https://lcsc.com/product-detail/Chip-Resistor-Surface-Mount-UniOhm_10KR-1002-1_C25804.html; Source: JLCEDA/EasyEDA Official Library (https://easyeda.com, https://lceda.cn)
VD1 = BZT52C12V: Manufacturer: JUXING; Manufacturer Part Number: BZT52C12V; LCSC Part: C5182293; Supplier: LCSC; Supplier Part Number: C5182293; JLCPCB Part Class: Extended Part; Datasheet: https://www.lcsc.com/datasheet/C5182293.pdf; Source: JLCEDA/EasyEDA Official Library (https://easyeda.com, https://lceda.cn)
VD2 = SMBJ24A_C224017: Manufacturer: Littelfuse; Manufacturer Part Number: SMBJ24A; LCSC Part: C224017; Supplier: LCSC; Supplier Part Number: C224017; JLCPCB Part Class: Extended Part; Datasheet: https://www.lcsc.com/datasheet/C224017.pdf; LCSC URL: https://lcsc.com/product-detail/Others_Littelfuse_SMBJ24A_Littelfuse-SMBJ24A_C224017.html; Source: JLCEDA/EasyEDA Official Library (https://easyeda.com, https://lceda.cn)
VD3-VD5 = SK86: Manufacturer: MDD; Manufacturer Part Number: SK86C; LCSC Part: C64338; Supplier: LCSC; Supplier Part Number: C64338; JLCPCB Part Class: Extended Part; Datasheet: https://www.lcsc.com/datasheet/C64338.pdf; LCSC URL: https://lcsc.com/product-detail/Schottky-Barrier-Diodes-SBD_SK86_C64338.html; Source: JLCEDA/EasyEDA Official Library (https://easyeda.com, https://lceda.cn)
VT1 = AOD4185: Manufacturer: AOS; Manufacturer Part Number: AOD4185L; LCSC Part: C77993; Supplier: LCSC; Supplier Part Number: C77993; JLCPCB Part Class: Extended Part; Datasheet: https://www.lcsc.com/datasheet/C77993.pdf; LCSC URL: https://lcsc.com/product-detail/MOSFET_AOS_AOD4185_AOD4185_C77993.html; Source: JLCEDA/EasyEDA Official Library (https://easyeda.com, https://lceda.cn)
XP2 XP3 = PZ254V-11-02P: Manufacturer: XFCN; Manufacturer Part Number: PZ254V-11-02P; LCSC Part: C492401; Supplier: LCSC; Supplier Part Number: C492401; JLCPCB Part Class: Extended Part; Datasheet: https://www.lcsc.com/datasheet/C492401.pdf; LCSC URL: https://lcsc.com/product-detail/New-Arrivals_XFCN-PZ254V-11-02P_C492401.html; Source: JLCEDA/EasyEDA Official Library (https://easyeda.com, https://lceda.cn)
XT1 = KF350-3.5-2P: Manufacturer: KEFA; Manufacturer Part Number: KF350-3.5-2P; LCSC Part: C474892; Supplier: LCSC; Supplier Part Number: C474892; JLCPCB Part Class: Extended Part; Datasheet: https://www.lcsc.com/datasheet/C474892.pdf; LCSC URL: https://lcsc.com/product-detail/New-Quadratic-Unclassified-Data_Cixi-Kefa-Elec-KF350-3-5-2P_C474892.html; Source: JLCEDA/EasyEDA Official Library (https://easyeda.com, https://lceda.cn)

## Sheet 2_MCU.SchDoc
size 528 x 337 mm; SheetNumber: 4; SheetTotal: 4
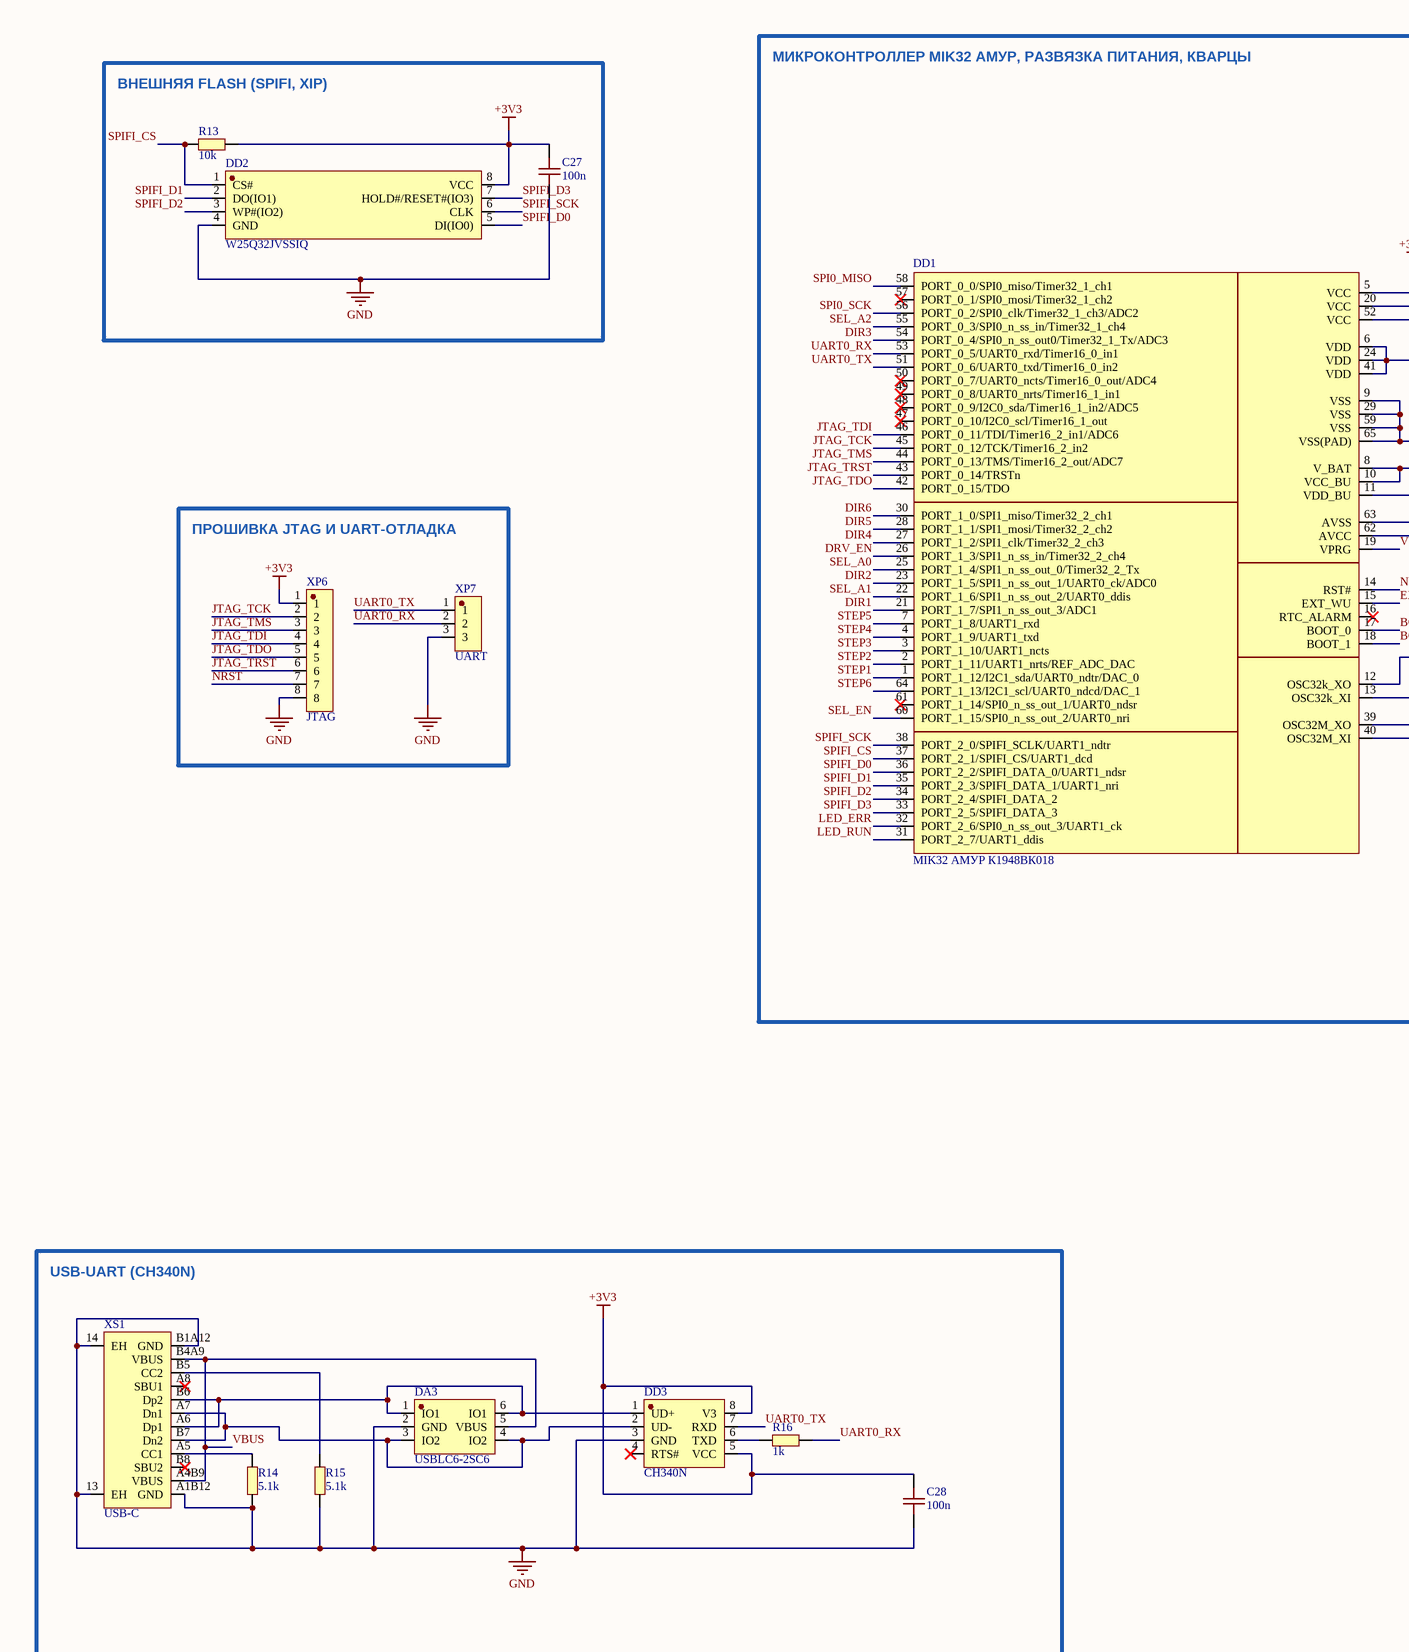
[diagram p3: 2_MCU.SchDoc, left]
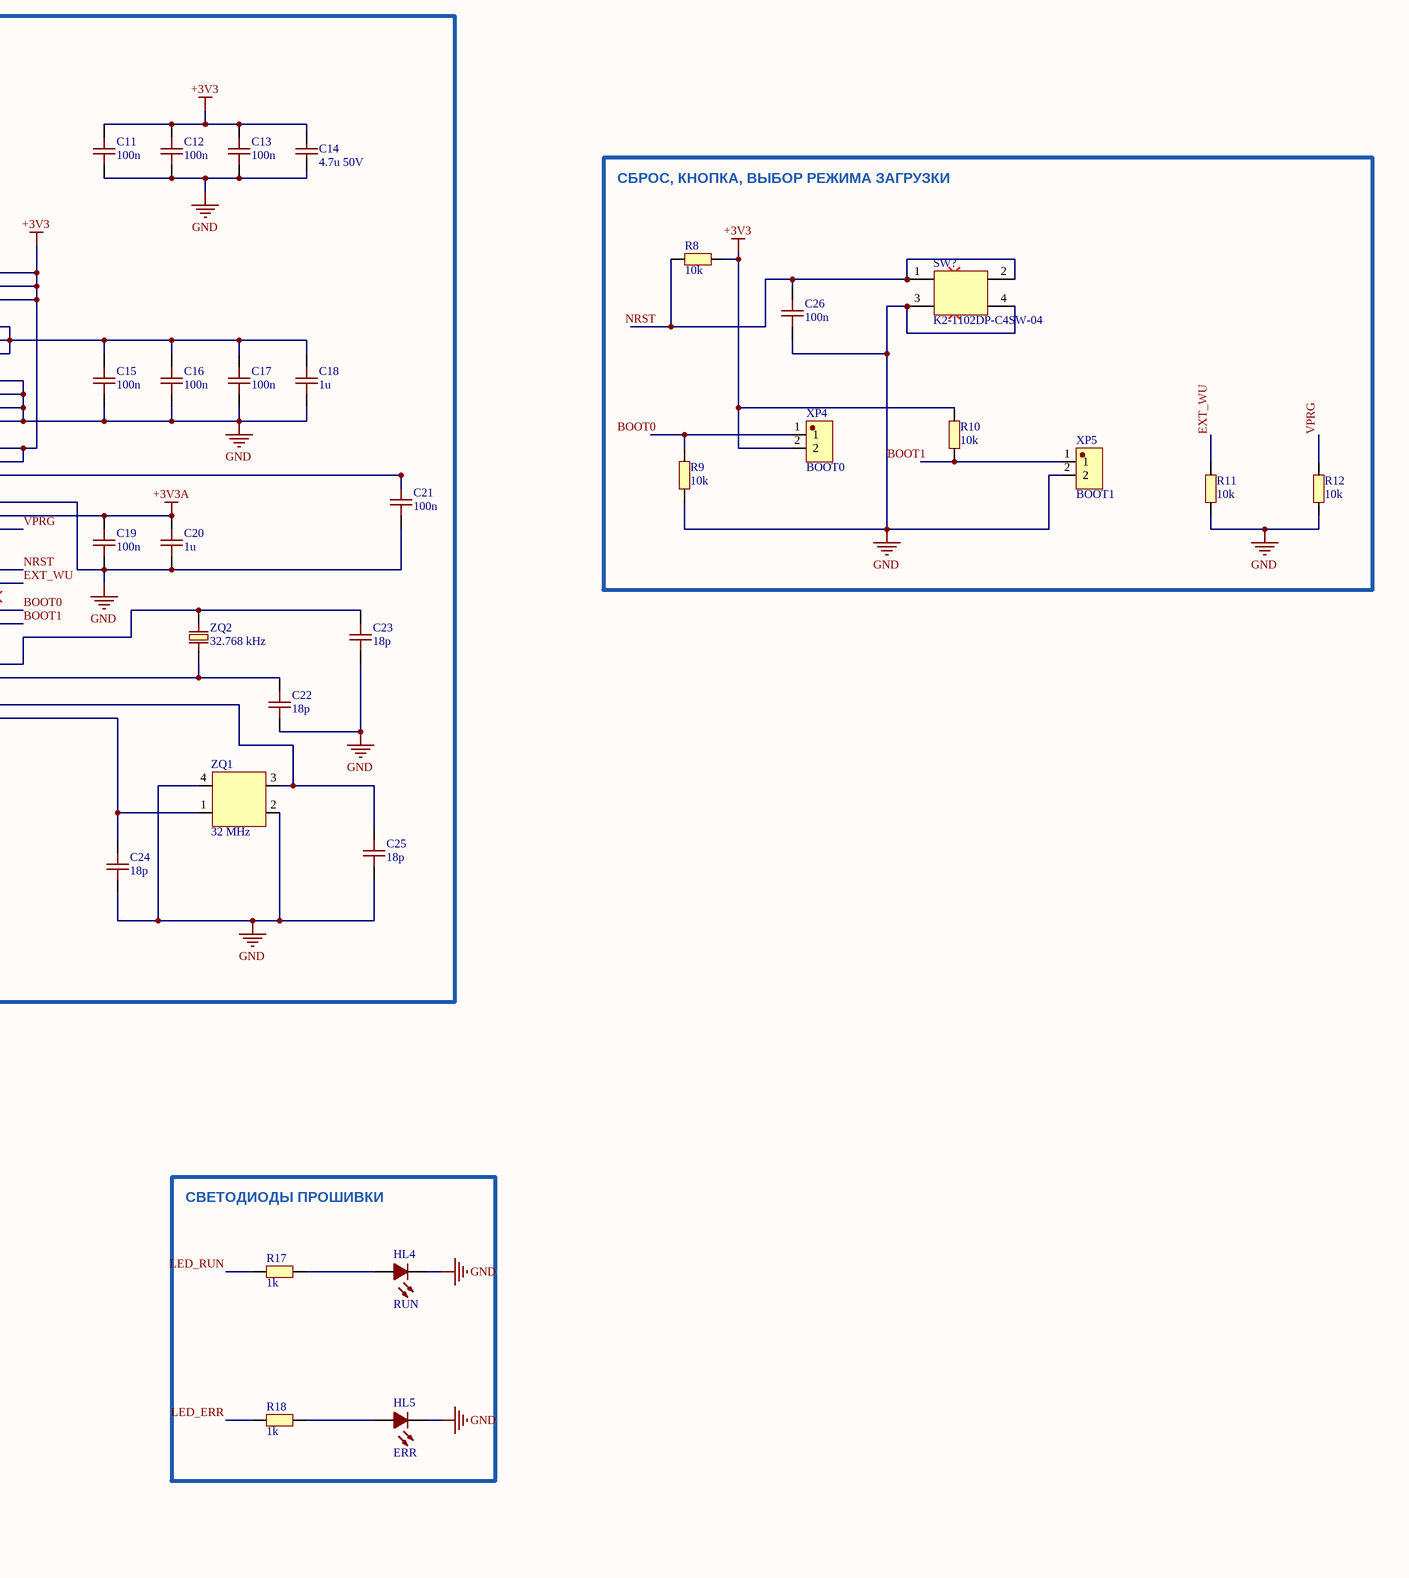
[diagram p4: 2_MCU.SchDoc, right]

### Parts
C11  100n  [C0603]
C12  100n  [C0603]
C13  100n  [C0603]
C14  4.7u 50V  [C1206]
C15  100n  [C0603]
C16  100n  [C0603]
C17  100n  [C0603]
C18  1u  [C0603]
C19  100n  [C0603]
C20  1u  [C0603]
C21  100n  [C0603]
C22  18p  [C0603]
C23  18p  [C0603]
C24  18p  [C0603]
C25  18p  [C0603]
C26  100n  [C0603]
C27  100n  [C0603]
C28  100n  [C0603]
DA3  USBLC6-2SC6  [SOT-23-6_L2.9-W1.6-P0.95-LS2.8-BL]
DD1  MIK32 АМУР К1948ВК018  [QFN-64_MCU32_PROD]
DD2  W25Q32JVSSIQ  [SOIC-8_L5.2-W5.2-P1.27-LS7.9-BL]
DD3  CH340N  [SOP-8_L5.0-W4.0-P1.27-LS6.0-BL]
HL4  RUN  [LED0603-RD_GREEN]
HL5  ERR  [LED0603-RD_GREEN]
R8  10k  [R0603]
R9  10k  [R0603]
R10  10k  [R0603]
R11  10k  [R0603]
R12  10k  [R0603]
R13  10k  [R0603]
R14  5.1k  [R0603]
R15  5.1k  [R0603]
R16  1k  [R0603]
R17  1k  [R0603]
R18  1k  [R0603]
SW?  K2-1102DP-C4SW-04  [KEY-TH_4P-L6.0-W6.0-P4.50-LS6.50]
XP4  BOOT0  [HDR-TH_2P-P2.54-V-M]
XP5  BOOT1  [HDR-TH_2P-P2.54-V-M]
XP6  JTAG  [HDR-TH_8P-P2.54-V-M]
XP7  UART  [HDR-TH_3P-P2.54-V-M_PZ254V-11-03P]
XS1  USB-C  [USB-C-SMD_TYPE-C-16PIN-2MD-073]
ZQ1  32 MHz  [CRYSTAL-SMD_4P-L3.2-W2.5-BL]
ZQ2  32.768 kHz  [FC-135R_L3.2-W1.5]

### Blocks framed on the sheet
ВНЕШНЯЯ FLASH (SPIFI, XIP): C27 DD2 R13
МИКРОКОНТРОЛЛЕР MIK32 АМУР, РАЗВЯЗКА ПИТАНИЯ, КВАРЦЫ: C11-C25 DD1 ZQ1 ZQ2
СБРОС, КНОПКА, ВЫБОР РЕЖИМА ЗАГРУЗКИ: C26 R8-R12 SW? XP4 XP5
ПРОШИВКА JTAG И UART-ОТЛАДКА: XP6 XP7
USB-UART (CH340N): C28 DA3 DD3 R14-R16 XS1
СВЕТОДИОДЫ ПРОШИВКИ: HL4 HL5 R17 R18

### Nets
+3V3: C11.1 C12.1 C13.1 C14.1 C27.1 C28.1 DD1.5(VCC) DD1.8(V_BAT) DD1.10(VCC_BU) DD1.20(VCC) DD1.52(VCC) DD2.8(VCC) DD3.5(VCC) DD3.8(V3) R8.2 R10.2 R13.2 XP4.2 XP6.1
+3V3A: C19.1 C20.1 DD1.62(AVCC)
GND: C11.2 C12.2 C13.2 C14.2 C15.2 C16.2 C17.2 C18.2 C19.2 C20.2 C21.2 C22.2 C23.2 C24.2 C25.2 C26.2 C27.2 C28.2 DA3.2(GND) DD1.9(VSS) DD1.29(VSS) DD1.59(VSS) DD1.63(AVSS) DD1.65(VSS(PAD)) DD2.4(GND) DD3.3(GND) HL4.1(C) HL5.1(C) R9.2 R11.2 R12.2 R14.2 R15.2 SW?.3 SW?.4 XP5.2 XP6.8 XP7.3 XS1.13(EH) XS1.14(EH) XS1.A1B12(GND) XS1.B1A12(GND) ZQ1.2(GND) ZQ1.4(GND)
BOOT0: DD1.17(BOOT_0) R9.1 XP4.1
BOOT1: DD1.18(BOOT_1) R10.1 XP5.1
DIR1: DD1.21(PORT_1_7/SPI1_n_ss_out_3/ADC1)
DIR2: DD1.23(PORT_1_5/SPI1_n_ss_out_1/UART0_ck/ADC0)
DIR3: DD1.54(PORT_0_4/SPI0_n_ss_out0/Timer32_1_Tx/ADC3)
DIR4: DD1.27(PORT_1_2/SPI1_clk/Timer32_2_ch3)
DIR5: DD1.28(PORT_1_1/SPI1_mosi/Timer32_2_ch2)
DIR6: DD1.30(PORT_1_0/SPI1_miso/Timer32_2_ch1)
DRV_EN: DD1.26(PORT_1_3/SPI1_n_ss_in/Timer32_2_ch4)
EXT_WU: DD1.15(EXT_WU) R11.1
JTAG_TCK: DD1.45(PORT_0_12/TCK/Timer16_2_in2) XP6.2
JTAG_TDI: DD1.46(PORT_0_11/TDI/Timer16_2_in1/ADC6) XP6.4
JTAG_TDO: DD1.42(PORT_0_15/TDO) XP6.5
JTAG_TMS: DD1.44(PORT_0_13/TMS/Timer16_2_out/ADC7) XP6.3
JTAG_TRST: DD1.43(PORT_0_14/TRSTn) XP6.6
LED_ERR: DD1.32(PORT_2_6/SPI0_n_ss_out_3/UART1_ck) R18.1
LED_RUN: DD1.31(PORT_2_7/UART1_ddis) R17.1
NRST: C26.1 DD1.14(RST#) R8.1 SW?.1 SW?.2 XP6.7
SEL_A0: DD1.25(PORT_1_4/SPI1_n_ss_out_0/Timer32_2_Tx)
SEL_A1: DD1.22(PORT_1_6/SPI1_n_ss_out_2/UART0_ddis)
SEL_A2: DD1.55(PORT_0_3/SPI0_n_ss_in/Timer32_1_ch4)
SEL_EN: DD1.60(PORT_1_15/SPI0_n_ss_out_2/UART0_nri)
SPI0_MISO: DD1.58(PORT_0_0/SPI0_miso/Timer32_1_ch1)
SPI0_SCK: DD1.56(PORT_0_2/SPI0_clk/Timer32_1_ch3/ADC2)
SPIFI_CS: DD1.37(PORT_2_1/SPIFI_CS/UART1_dcd) DD2.1(CS#) R13.1
SPIFI_D0: DD1.36(PORT_2_2/SPIFI_DATA_0/UART1_ndsr) DD2.5(DI(IO0))
SPIFI_D1: DD1.35(PORT_2_3/SPIFI_DATA_1/UART1_nri) DD2.2(DO(IO1))
SPIFI_D2: DD1.34(PORT_2_4/SPIFI_DATA_2) DD2.3(WP#(IO2))
SPIFI_D3: DD1.33(PORT_2_5/SPIFI_DATA_3) DD2.7(HOLD#/RESET#(IO3))
SPIFI_SCK: DD1.38(PORT_2_0/SPIFI_SCLK/UART1_ndtr) DD2.6(CLK)
STEP1: DD1.1(PORT_1_12/I2C1_sda/UART0_ndtr/DAC_0)
STEP2: DD1.2(PORT_1_11/UART1_nrts/REF_ADC_DAC)
STEP3: DD1.3(PORT_1_10/UART1_ncts)
STEP4: DD1.4(PORT_1_9/UART1_txd)
STEP5: DD1.7(PORT_1_8/UART1_rxd)
STEP6: DD1.64(PORT_1_13/I2C1_scl/UART0_ndcd/DAC_1)
UART0_RX: DD1.53(PORT_0_5/UART0_rxd/Timer16_0_in1) R16.2 XP7.2
UART0_TX: DD1.51(PORT_0_6/UART0_txd/Timer16_0_in2) DD3.7(RXD) XP7.1
VBUS: DA3.5(VBUS) XS1.A4B9(VBUS) XS1.B4A9(VBUS)
VPRG: DD1.19(VPRG) R12.1
NetC15_1: C15.1 C16.1 C17.1 C18.1 DD1.6(VDD) DD1.24(VDD) DD1.41(VDD)
NetC21_1: C21.1 DD1.11(VDD_BU)
NetC22_1: C22.1 DD1.13(OSC32k_XI) ZQ2.1
NetC23_1: C23.1 DD1.12(OSC32k_XO) ZQ2.2
NetC24_1: C24.1 DD1.40(OSC32M_XI) ZQ1.1(OSC1)
NetC25_1: C25.1 DD1.39(OSC32M_XO) ZQ1.3(OSC2)
NetDA3_1: DA3.1(IO1) DA3.6(IO1) DD3.1(UD+) XS1.A6(Dp1) XS1.B6(Dp2)
NetDA3_3: DA3.3(IO2) DA3.4(IO2) DD3.2(UD-) XS1.A7(Dn1) XS1.B7(Dn2)
NetDD3_6: DD3.6(TXD) R16.1
NetHL4_2: HL4.2(A) R17.2
NetHL5_2: HL5.2(A) R18.2
NetR14_1: R14.1 XS1.A5(CC1)
NetR15_1: R15.1 XS1.B5(CC2)

Not connected (* = marked no-connect by the designer): DD1 16(RTC_ALARM)* 47(PORT_0_10/I2C0_scl/Timer16_1_out)* 48(PORT_0_9/I2C0_sda/Timer16_1_in2/ADC5)* 49(PORT_0_8/UART0_nrts/Timer16_1_in1)* 50(PORT_0_7/UART0_ncts/Timer16_0_out/ADC4)* 57(PORT_0_1/SPI0_mosi/Timer32_1_ch2)* 61(PORT_1_14/SPI0_n_ss_out_1/UART0_ndsr)*; DD3 4(RTS#)*; XS1 A8(SBU1)* B8(SBU2)*

### Library data of the parts
C11-C13 C15-C28 = CL10B104KB8NNNC/0603: Manufacturer Part Number: CL10B104KB8NNNC/0603; LCSC Part: C9900007620; Supplier: LCSC; Supplier Part Number: C9900007620; Datasheet: https://www.lcsc.com/datasheet/C9900007620.pdf; Source: JLCEDA/EasyEDA Official Library (https://easyeda.com, https://lceda.cn)
C14 = CL31B475KBHNNNE: as C2 on sheet 1_Power; Value: 4.7uF; Manufacturer Part Number: CL31B475KBHNNNE; LCSC Part: C51205; Supplier: LCSC; Supplier Part Number: C51205; JLCPCB Part Class: Extended Part; Datasheet: https://www.lcsc.com/datasheet/C51205.pdf; LCSC URL: https://lcsc.com/product-detail/Multilayer-Ceramic-Capacitors-MLCC-SMD-SMT_SAMSUNG_CL31B475KBHNNNE_4-7uF-475-10-50V_C51205.html; Source: JLCEDA/EasyEDA Official Library (https://easyeda.com, https://lceda.cn)
DA3 = USBLC6-2SC6_C2827654: Manufacturer: TECH PUBLIC; Manufacturer Part Number: USBLC6-2SC6; LCSC Part: C2827654; Supplier: LCSC; Supplier Part Number: C2827654; JLCPCB Part Class: Extended Part; Datasheet: https://www.lcsc.com/datasheet/C2827654.pdf; Source: JLCEDA/EasyEDA Official Library (https://easyeda.com, https://lceda.cn)
DD1 = MIK32_K1948BK018 [vladkovalev3303]: Manufacturer: Mikron; Manufacturer Part Number: MCU32; EasyEDA Component: c698b5f0ec9d426a8ac2146e656034b7; Source: EasyEDA user library (author: vladkovalev3303), https://easyeda.com/component/c698b5f0ec9d426a8ac2146e656034b7
DD2 = W25Q32JVSSIQ TR: Manufacturer: WINBOND; Manufacturer Part Number: W25Q32JVSSIQ TR; LCSC Part: C2441426; Supplier: LCSC; Supplier Part Number: C2441426; JLCPCB Part Class: Extended Part; Datasheet: https://www.lcsc.com/datasheet/C2441426.pdf; Source: JLCEDA/EasyEDA Official Library (https://easyeda.com, https://lceda.cn)
HL4 HL5 = KT-0603GH: Manufacturer Part Number: KT-0603GH; LCSC Part: C9900005170; Supplier: LCSC; Supplier Part Number: C9900005170; JLCPCB Part Class: Extended Part; Datasheet: https://www.lcsc.com/datasheet/C9900005170.pdf; Source: JLCEDA/EasyEDA Official Library (https://easyeda.com, https://lceda.cn)
R8-R18 = 0603WAF1002T5E: as R19 on sheet 3_IO; Manufacturer Part Number: 0603WAF1002T5E; LCSC Part: C25804; Supplier: LCSC; Supplier Part Number: C25804; JLCPCB Part Class: Basic Part; Datasheet: https://www.lcsc.com/datasheet/C25804.pdf; LCSC URL: https://lcsc.com/product-detail/Chip-Resistor-Surface-Mount-UniOhm_10KR-1002-1_C25804.html; Source: JLCEDA/EasyEDA Official Library (https://easyeda.com, https://lceda.cn)
XP4 XP5 = PZ254V-11-02P: Manufacturer: XFCN; Manufacturer Part Number: PZ254V-11-02P; LCSC Part: C492401; Supplier: LCSC; Supplier Part Number: C492401; JLCPCB Part Class: Extended Part; Datasheet: https://www.lcsc.com/datasheet/C492401.pdf; LCSC URL: https://lcsc.com/product-detail/New-Arrivals_XFCN-PZ254V-11-02P_C492401.html; Source: JLCEDA/EasyEDA Official Library (https://easyeda.com, https://lceda.cn)
XP6 = PZ254V-11-08P: Manufacturer: XFCN; Manufacturer Part Number: PZ254V-11-08P; LCSC Part: C492407; Supplier: LCSC; Supplier Part Number: C492407; JLCPCB Part Class: Extended Part; Datasheet: https://www.lcsc.com/datasheet/C492407.pdf; LCSC URL: https://lcsc.com/product-detail/New-Arrivals_XFCN-PZ254V-11-08P_C492407.html; Source: JLCEDA/EasyEDA Official Library (https://easyeda.com, https://lceda.cn)
XP7 = PZ254V-11-03P_C2937625: Manufacturer: XFCN; Manufacturer Part Number: PZ254V-11-03P; LCSC Part: C2937625; Supplier: LCSC; Supplier Part Number: C2937625; JLCPCB Part Class: Extended Part; Datasheet: https://www.lcsc.com/datasheet/C2937625.pdf; Source: JLCEDA/EasyEDA Official Library (https://easyeda.com, https://lceda.cn)
XS1 = TYPE-C 16PIN 2MD(073): Manufacturer: SHOU HAN; Manufacturer Part Number: TYPE-C 16PIN 2MD(073); LCSC Part: C2765186; Supplier: LCSC; Supplier Part Number: C2765186; JLCPCB Part Class: Extended Part; Datasheet: https://www.lcsc.com/datasheet/C2765186.pdf; Source: JLCEDA/EasyEDA Official Library (https://easyeda.com, https://lceda.cn)
ZQ1 = X322532MOB4SI: YSX321SL 32MHZ 12PF 10PPM -40~+85; Manufacturer: YXC; Value: 32MHz; Manufacturer Part Number: X322532MOB4SI; LCSC Part: C9009; Supplier: LCSC; Supplier Part Number: C9009; JLCPCB Part Class: Extended Part; Datasheet: https://www.lcsc.com/datasheet/C9009.pdf; LCSC URL: https://lcsc.com/product-detail/SMD-Crystals_YSX321SL-32MHZ-12PF-10PPM-40-85_C9009.html; Source: JLCEDA/EasyEDA Official Library (https://easyeda.com, https://lceda.cn)
ZQ2 = Q13FC1350000400: 32.768KHz ±20ppm 12.5pF; Manufacturer: EPSON; Value: 32.768kHz; Manufacturer Part Number: Q13FC13500004; LCSC Part: C32346; Supplier: LCSC; Supplier Part Number: C32346; JLCPCB Part Class: Basic Part; Datasheet: https://www.lcsc.com/datasheet/C32346.pdf; LCSC URL: https://lcsc.com/product-detail/SMD-Crystals_EPSON_Q13FC1350000400_32-768KHz-20ppm-12-5pF_C32346.html; Source: JLCEDA/EasyEDA Official Library (https://easyeda.com, https://lceda.cn)
DD3 = CH340N: Manufacturer Part Number: CH340N; LCSC Part: C506813; Supplier: LCSC; Supplier Part Number: C506813; JLCPCB Part Class: Extended Part; Datasheet: https://www.lcsc.com/datasheet/C506813.pdf; LCSC URL: https://lcsc.com/product-detail/USB-ICs_WCH-Jiangsu-Qin-Heng-CH340N_C506813.html; Source: JLCEDA/EasyEDA Official Library (https://easyeda.com, https://lceda.cn)
SW? = K2-1102DP-C4SW-04: Manufacturer Part Number: K2-1102DP-C4SW-04; LCSC Part: C110153; Supplier: LCSC; Supplier Part Number: C110153; JLCPCB Part Class: Extended Part; Datasheet: https://www.lcsc.com/datasheet/C110153.pdf; LCSC URL: https://lcsc.com/product-detail/Tactile-Switches_Button6-6-5_C110153.html; Source: JLCEDA/EasyEDA Official Library (https://easyeda.com, https://lceda.cn)

## Nets that join several sheets
+3V3: 4_Drivers (24 pins), 3_IO (18 pins), 1_Power (C10.1 DA2.5 FB1.1 R7.1), 2_MCU (19 pins)
+3V3A: 1_Power (FB1.2), 2_MCU (C19.1 C20.1 DD1.62)
+5V: 3_IO (6 pins), 1_Power (5 pins)
+24V: 4_Drivers (18 pins), 1_Power (9 pins)
GND: 4_Drivers (36 pins), 3_IO (33 pins), 1_Power (23 pins), 2_MCU (44 pins)
DIR1: 4_Drivers (XS2.8), 2_MCU (DD1.21)
DIR2: 4_Drivers (XS4.8), 2_MCU (DD1.23)
DIR3: 4_Drivers (XS6.8), 2_MCU (DD1.54)
DIR4: 4_Drivers (XS8.8), 2_MCU (DD1.27)
DIR5: 4_Drivers (XS10.8), 2_MCU (DD1.28)
DIR6: 4_Drivers (XS12.8), 2_MCU (DD1.30)
DRV_EN: 3_IO (R20.1), 2_MCU (DD1.26)
DRV_ENN: 4_Drivers (6 pins), 3_IO (R22.1 VT2.2)
SEL_A0: 3_IO (DD4.1), 2_MCU (DD1.25)
SEL_A1: 3_IO (DD4.2), 2_MCU (DD1.22)
SEL_A2: 3_IO (DD4.3), 2_MCU (DD1.55)
SEL_EN: 3_IO (DD4.6 R19.1), 2_MCU (DD1.60)
SPI0_MISO: 3_IO (7 pins), 2_MCU (DD1.58)
SPI0_SCK: 3_IO (7 pins), 2_MCU (DD1.56)
STEP1: 4_Drivers (XS2.7), 2_MCU (DD1.1)
STEP2: 4_Drivers (XS4.7), 2_MCU (DD1.2)
STEP3: 4_Drivers (XS6.7), 2_MCU (DD1.3)
STEP4: 4_Drivers (XS8.7), 2_MCU (DD1.4)
STEP5: 4_Drivers (XS10.7), 2_MCU (DD1.7)
STEP6: 4_Drivers (XS12.7), 2_MCU (DD1.64)
VBUS: 1_Power (VD5.1), 2_MCU (DA3.5 XS1.A4B9 XS1.B4A9)